# Altium schematic sheet Opto_Section.SchDoc
size A4; DocumentNumber: 4; SheetNumber: 4; SheetTotal: 5
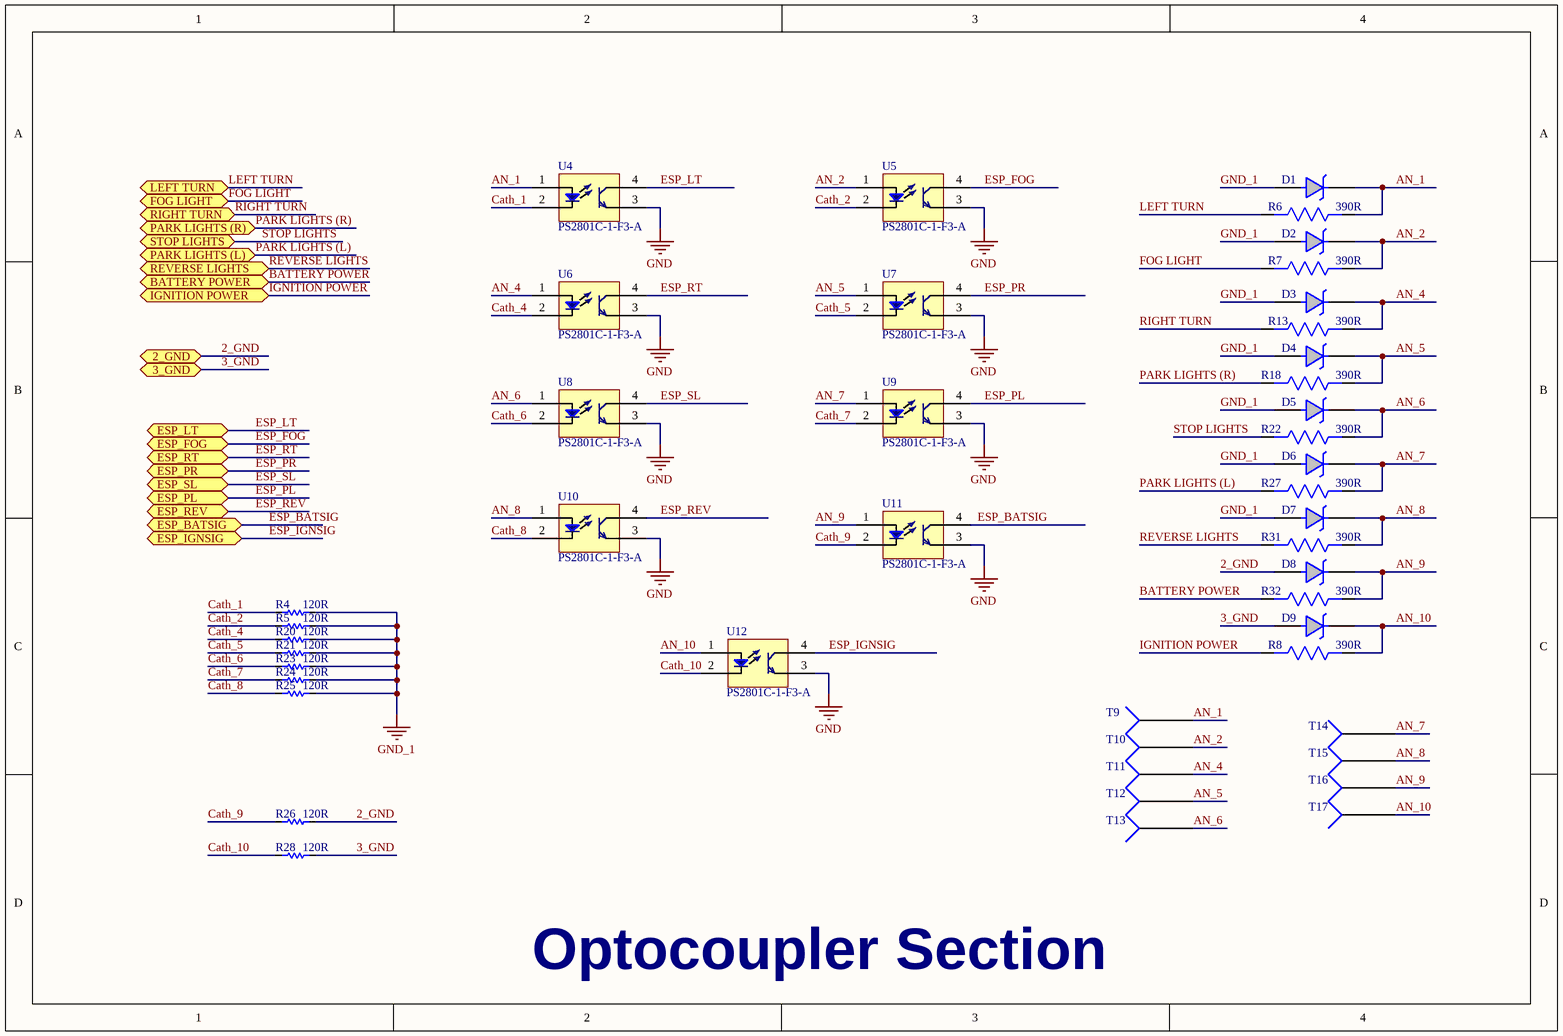
[diagram p0: Opto_Section.SchDoc]

## Parts
D1  MM3Z3V3B  [MM3Z3V3B]  (value not drawn)
D2  MM3Z3V3B  [MM3Z3V3B]  (value not drawn)
D3  MM3Z3V3B  [MM3Z3V3B]  (value not drawn)
D4  MM3Z3V3B  [MM3Z3V3B]  (value not drawn)
D5  MM3Z3V3B  [MM3Z3V3B]  (value not drawn)
D6  MM3Z3V3B  [MM3Z3V3B]  (value not drawn)
D7  MM3Z3V3B  [MM3Z3V3B]  (value not drawn)
D8  MM3Z3V3B  [MM3Z3V3B]  (value not drawn)
D9  MM3Z3V3B  [MM3Z3V3B]  (value not drawn)
R4  120R  [Res-0603]
R5  120R  [Res-0603]
R6  390R  [Res1218]
R7  390R  [Res1218]
R8  390R  [Res1218]
R13  390R  [Res1218]
R18  390R  [Res1218]
R20  120R  [Res-0603]
R21  120R  [Res-0603]
R22  390R  [Res1218]
R23  120R  [Res-0603]
R24  120R  [Res-0603]
R25  120R  [Res-0603]
R26  120R  [Res-0603]
R27  390R  [Res1218]
R28  120R  [Res-0603]
R31  390R  [Res1218]
R32  390R  [Res1218]
T9  Socket  [Socket]  (value not drawn)
T10  Socket  [Socket]  (value not drawn)
T11  Socket  [Socket]  (value not drawn)
T12  Socket  [Socket]  (value not drawn)
T13  Socket  [Socket]  (value not drawn)
T14  Socket  [Socket]  (value not drawn)
T15  Socket  [Socket]  (value not drawn)
T16  Socket  [Socket]  (value not drawn)
T17  Socket  [Socket]  (value not drawn)
U4  PS2801C-1-F3-A  [PS2801C-1-F3-A]
U5  PS2801C-1-F3-A  [PS2801C-1-F3-A]
U6  PS2801C-1-F3-A  [PS2801C-1-F3-A]
U7  PS2801C-1-F3-A  [PS2801C-1-F3-A]
U8  PS2801C-1-F3-A  [PS2801C-1-F3-A]
U9  PS2801C-1-F3-A  [PS2801C-1-F3-A]
U10  PS2801C-1-F3-A  [PS2801C-1-F3-A]
U11  PS2801C-1-F3-A  [PS2801C-1-F3-A]
U12  PS2801C-1-F3-A  [PS2801C-1-F3-A]

## Ports
2_GND (bidir), 3_GND (bidir), BATTERY POWER (bidir), ESP_BATSIG (bidir), ESP_FOG (bidir), ESP_IGNSIG (bidir), ESP_LT (bidir), ESP_PL (bidir), ESP_PR (bidir), ESP_REV (bidir), ESP_RT (bidir), ESP_SL (bidir), FOG LIGHT (bidir), IGNITION POWER (bidir), LEFT TURN (bidir), PARK LIGHTS (L) (bidir), PARK LIGHTS (R) (bidir), REVERSE LIGHTS (bidir), RIGHT TURN (bidir), STOP LIGHTS (bidir)

## Nets
GND: U4.3(E) U5.3(E) U6.3(E) U7.3(E) U8.3(E) U9.3(E) U10.3(E) U11.3(E) U12.3(E)
GND_1: D1.1(ANODE) D2.1(ANODE) D3.1(ANODE) D4.1(ANODE) D5.1(ANODE) D6.1(ANODE) D7.1(ANODE) R4.2 R5.2 R20.2 R21.2 R23.2 R24.2 R25.2
2_GND: D8.1(ANODE) R26.2 ; port 2_GND
3_GND: D9.1(ANODE) R28.2 ; port 3_GND
AN_1: D1.2(CATHODE) R6.1 T9.1 U4.1(An)
AN_2: D2.2(CATHODE) R7.1 T10.1 U5.1(An)
AN_4: D3.2(CATHODE) R13.1 T11.1 U6.1(An)
AN_5: D4.2(CATHODE) R18.1 T12.1 U7.1(An)
AN_6: D5.2(CATHODE) R22.1 T13.1 U8.1(An)
AN_7: D6.2(CATHODE) R27.1 T14.1 U9.1(An)
AN_8: D7.2(CATHODE) R31.1 T15.1 U10.1(An)
AN_9: D8.2(CATHODE) R32.1 T16.1 U11.1(An)
AN_10: D9.2(CATHODE) R8.1 T17.1 U12.1(An)
BATTERY POWER: R32.2 ; port BATTERY POWER
Cath_1: R4.1 U4.2(Ca)
Cath_2: R5.1 U5.2(Ca)
Cath_4: R20.1 U6.2(Ca)
Cath_5: R21.1 U7.2(Ca)
Cath_6: R23.1 U8.2(Ca)
Cath_7: R24.1 U9.2(Ca)
Cath_8: R25.1 U10.2(Ca)
Cath_9: R26.1 U11.2(Ca)
Cath_10: R28.1 U12.2(Ca)
ESP_BATSIG: U11.4(C) ; port ESP_BATSIG
ESP_FOG: U5.4(C) ; port ESP_FOG
ESP_IGNSIG: U12.4(C) ; port ESP_IGNSIG
ESP_LT: U4.4(C) ; port ESP_LT
ESP_PL: U9.4(C) ; port ESP_PL
ESP_PR: U7.4(C) ; port ESP_PR
ESP_REV: U10.4(C) ; port ESP_REV
ESP_RT: U6.4(C) ; port ESP_RT
ESP_SL: U8.4(C) ; port ESP_SL
FOG LIGHT: R7.2 ; port FOG LIGHT
IGNITION POWER: R8.2 ; port IGNITION POWER
LEFT TURN: R6.2 ; port LEFT TURN
PARK LIGHTS (L): R27.2 ; port PARK LIGHTS (L)
PARK LIGHTS (R): R18.2 ; port PARK LIGHTS (R)
REVERSE LIGHTS: R31.2 ; port REVERSE LIGHTS
RIGHT TURN: R13.2 ; port RIGHT TURN
STOP LIGHTS: R22.2 ; port STOP LIGHTS

## Notes on the sheet
- Optocoupler Section

## Library data of the parts
D1-D9 = MM3Z3V3B: DIODE ZENER 3.3V 200MW SOD323F; Manufacturer: ON Semiconductor / Fairchild; Forward Voltage: 1V; Tolerance: 2%; Impedance: 89R; Max Reverse Leakage Current: 4.5uA; Test Current: 5mA; Element Configuration: Single; Supplier 1: Digi-Key; Manufacturer Part Number: MM3Z3V3B; Stock 1: 473644; Pricing 1: 1=0.22, 10=0.18, 100=0.0956, 500=0.06288, 1000=0.04276 (USD); Mount: Surface Mount; Number of Pins: 2; Weight: 0.0276g; Min Operating Temperature: -65°C; Max Operating Temperature: 150°C; Packaging: Tape and Reel; Package Quantity: 1; Max Power Dissipation: 200mW; Zener Voltage: 3.3V; Voltage Tolerance: 2%; Power Dissipation: 200mW; Working Voltage: 3.3V; Peak Reverse Current: 4.5uA; Length: 1.3mm; Height: 1mm; Width: 1.7mm; Radiation Hardening: No; REACH SVHC: No SVHC; Lead Free: Lead Free; ComponentLink1URL: http://www.onsemi.com/pub/Collateral/MM3Z9V1B-D.pdf?src-supplier=Digi-Key; ComponentLink1Description: http://www.onsemi.com/pub/Collateral/MM3Z9V1B-D.pdf?src-supplier=Digi-Key; ComponentLink2URL: http://www.mouser.com/ds/2/149/MM3Z3V3B-187166.pdf?src-supplier=Mouser; ComponentLink2Description: http://www.mouser.com/ds/2/149/MM3Z3V3B-187166.pdf?src-supplier=Mouser; ComponentLink3URL: https://www.fairchildsemi.com/datasheets/MM/MM3Z9V1B.pdf?src-supplier=Avnet; ComponentLink3Description: https://www.fairchildsemi.com/datasheets/MM/MM3Z9V1B.pdf?src-supplier=Avnet; ComponentLink4URL: http://www.farnell.com/datasheets/1706525.pdf?src-supplier=Element14; ComponentLink4Description: http://www.farnell.com/datasheets/1706525.pdf?src-supplier=Element14; Supplier Part Number 1: MM3Z3V3BCT-ND
R4 R5 R20 R21 R23-R26 R28 = RC0603FR-07120RL: RES 120 OHM 1% 1/10W 0603; Manufacturer: Yageo; Temperature Coefficient: 100ppm/°C; Voltage Rating (DC): 50V; Power Rating: 100mW; Supplier 1: Digi-Key; Manufacturer Part Number: RC0603FR-07120RL; RoHS: Yes; Category: Chip SMD Resistors; Stock 1: 839061; Pricing 1: 1=0.10000, 10=0.02400, 100=0.00970, 1000=0.00436, 2500=0.00378 (USD); Case/Package: 0603; Number of Pins: 2; Case Code (Metric): 1608; Case Code (Imperial): 0603; Size Code: 0603; Min Operating Temperature: -55°C; Max Operating Temperature: 155°C; Resistance: 120R; Tolerance: 1%; Resistor Type: Thick Film; Packaging: Tape and Reel; Voltage Rating: 50V; Package Quantity: 1; Number of Terminations: 2; Termination: SMD/SMT; Max Power Dissipation: 100mW; Features: Moisture Resistant; Series: RC; Construction: Rectangular; Resistance Tolerance: 1%; Length: 1.6mm; Width: 0.031inch; Height: 0.022inch; Depth: 0.8mm; REACH SVHC: No SVHC; Lead Free: Lead Free; Military Standard: Not; RoHS Compliant: Yes; ComponentLink1URL: https://datasheet.ciiva.com/2553/pyu-r-int-thick-7-2553512.pdf?src-supplier=Digi-Key; ComponentLink1Description: https://datasheet.ciiva.com/2553/pyu-r-int-thick-7-2553512.pdf?src-supplier=Digi-Key; ComponentLink2URL: https://datasheet.ciiva.com/7746/443971-7746248.pdf?src-supplier=Element14; ComponentLink2Description: https://datasheet.ciiva.com/7746/443971-7746248.pdf?src-supplier=Element14; ComponentLink3URL: https://datasheet.ciiva.com/2553/pyu-r-int-thick-7-2553513.pdf?src-supplier=Digi-Key; ComponentLink3Description: https://datasheet.ciiva.com/2553/pyu-r-int-thick-7-2553513.pdf?src-supplier=Digi-Key; ComponentLink4URL: https://datasheet.ciiva.com/7746/443971-7746249.pdf?src-supplier=Element14; ComponentLink4Description: https://datasheet.ciiva.com/7746/443971-7746249.pdf?src-supplier=Element14; ComponentLink5URL: https://datasheet.ciiva.com/2553/pyu-r-int-thick-7-2553514.pdf?src-supplier=Digi-Key; ComponentLink5Description: https://datasheet.ciiva.com/2553/pyu-r-int-thick-7-2553514.pdf?src-supplier=Digi-Key; ComponentLink6URL: https://datasheet.ciiva.com/46395/443971-46395021.pdf?src-supplier=Element14; ComponentLink6Description: https://datasheet.ciiva.com/46395/443971-46395021.pdf?src-supplier=Element14; Supplier Part Number 1: 311-120HRCT-ND; LCSC Part Number: C114640
R6-R8 R13 R18 R22 R27 R31 R32 = CRW1218F390RE04Z: RES SMD 390 OHM ±1% 1W ±100ppm/℃ 1218 Chip Resistor; Manufacturer: Ever Ohms Tech; Case/Package: 1218; Resistance: 390R; Termination: SMD/SMT; ComponentLink1URL: http://www.yageo.com.tw/exep/pages/download/literatures/PYu-R_INT-thick_7.pdf?src-supplier=Digi-Key; ComponentLink1Description: http://www.yageo.com.tw/exep/pages/download/literatures/PYu-R_INT-thick_7.pdf?src-supplier=Digi-Key; ComponentLink2URL: http://www.yageo.com/documents/recent/PYu-RC_Group_51_RoHS_L_10.pdf?src-supplier=Digi-Key; ComponentLink2Description: http://www.yageo.com/documents/recent/PYu-RC_Group_51_RoHS_L_10.pdf?src-supplier=Digi-Key; ComponentLink3URL: http://www.yageo.com/documents/recent/PYu-RC_Group_51_RoHS_L_9.pdf?src-supplier=Digi-Key; ComponentLink3Description: http://www.yageo.com/documents/recent/PYu-RC_Group_51_RoHS_L_9.pdf?src-supplier=Digi-Key; ComponentLink4URL: http://www.farnell.com/datasheets/443971.pdf?src-supplier=Element14; ComponentLink4Description: http://www.farnell.com/datasheets/443971.pdf?src-supplier=Element14; Supplier: LCSC; Supplier Part No.: C175553; Manufacturer Part No.: CRW1218F390RE04Z; Link: https://lcsc.com/product-detail/Chip-Resistor-Surface-Mount_Ever-Ohms-Tech-CR1218F390RE04_C175553.html
U4-U12 = PS2801C-1-F3-A: TransistorOptocouplers DC 1 2500Vrms SOP-4_P1.27 Optocouplers RoHS; Manufacturer: CEL; Number of Channels: 1; Collector Emitter Voltage (VCEO): 300mV; Forward Voltage: 1.2V; Max Power Dissipation: 120mW; Max Collector Current: 30mA; Max Output Voltage: 80V; Supplier 1: Digi-Key; Manufacturer Part Number: PS2801C-1-F3-A; Stock 1: 399; Pricing 1: 1=0.77, 10=0.595, 100=0.3825 (USD); Mount: Surface Mount; Case/Package: SOIC; Number of Pins: 4; Min Operating Temperature: -55°C; Max Operating Temperature: 100°C; Packaging: Tape and Reel; Collector Emitter Saturation Voltage: 300mV; Package Quantity: 1; Output Current per Channel: 30mA; Lead Free: Lead Free; ComponentLink1URL: http://www.cel.com/pdf/datasheets/PS2801C-1,PS2801C-4.pdf?src-supplier=Digi-Key; ComponentLink1Description: http://www.cel.com/pdf/datasheets/PS2801C-1,PS2801C-4.pdf?src-supplier=Digi-Key; ComponentLink2URL: http://www.cel.com/pdf/datasheets/how_to_order_optos.pdf?src-supplier=Digi-Key; ComponentLink2Description: http://www.cel.com/pdf/datasheets/how_to_order_optos.pdf?src-supplier=Digi-Key; ComponentLink3URL: http://datasheet.iiic.cc/cel/PS2801C-1-F3-A.pdf?src-supplier=IIIC; ComponentLink3Description: http://datasheet.iiic.cc/cel/PS2801C-1-F3-A.pdf?src-supplier=IIIC; Supplier Part Number 1: PS2801C-1-F3-ACT-ND
T9-T17 = Socket: LatestRevisionDate: 17-Jul-2002; LatestRevisionNote: Re-released for DXP Platform.; Publisher: Altium Limited